# Altium project My_FOC_v1_Driver.PrjPcb
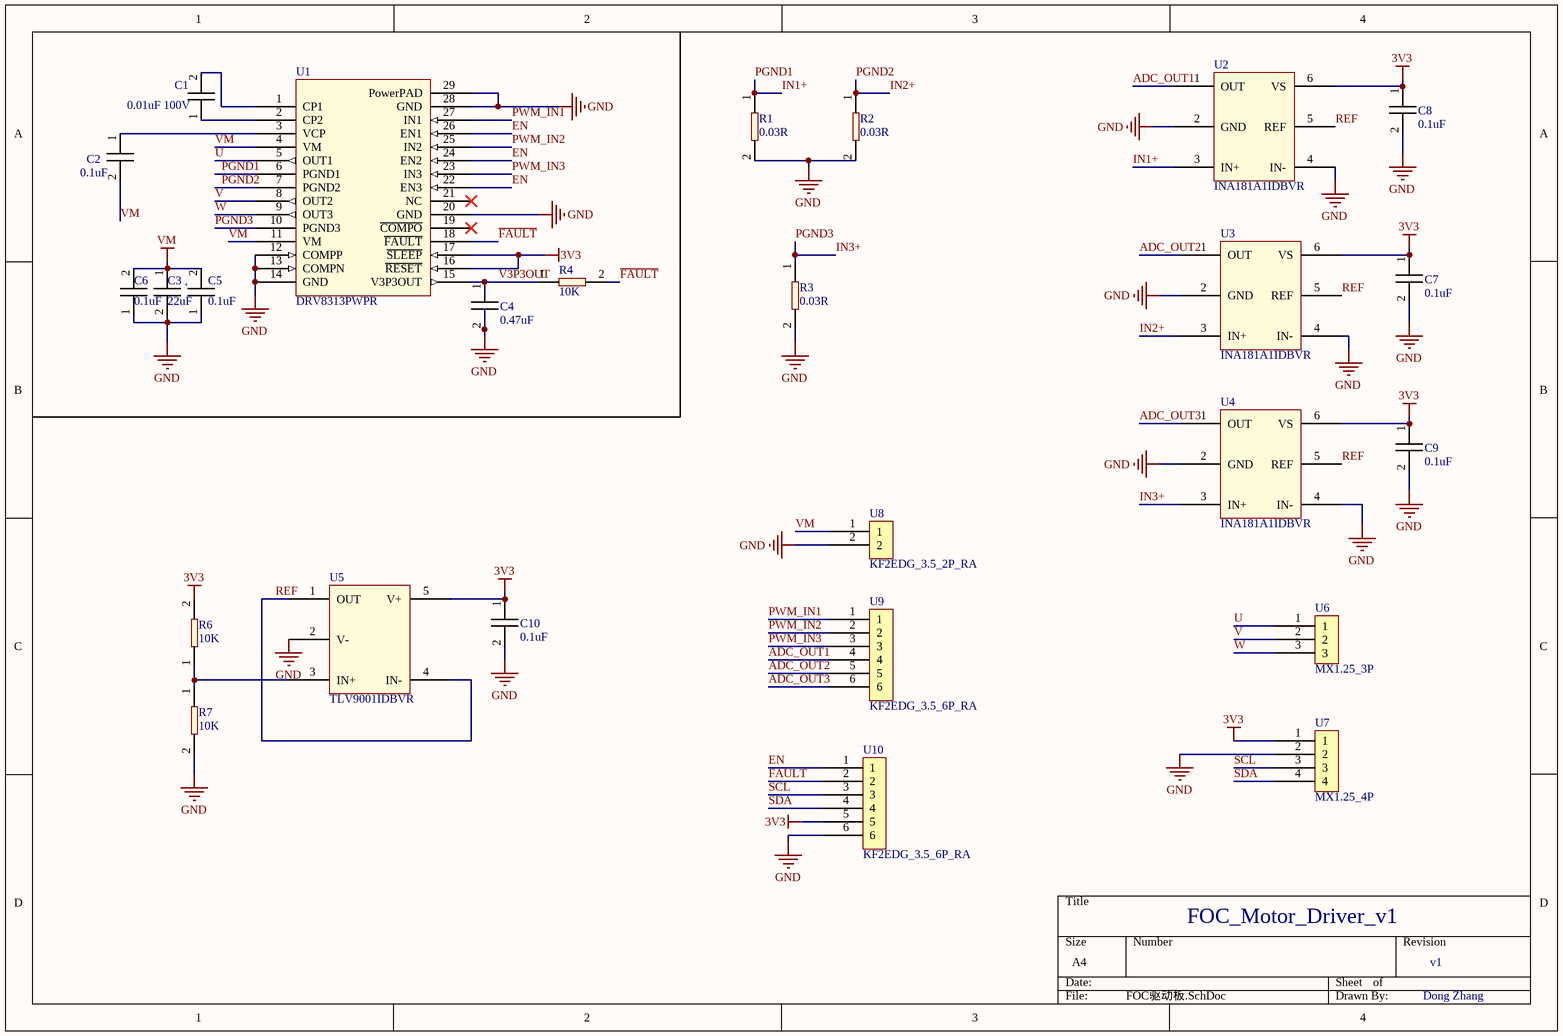
[diagram p0: FOC驱动板.SchDoc]
1 sheet, 26 parts. Net scope: global (net labels, ports and power ports of the same name join across sheets).
Board file: PCB1.PcbDoc

## Sheet FOC驱动板.SchDoc
size A4; SheetNumber: 1; SheetTotal: 1

### Parts
C1  0.01uF 100V  [CAP_0603_1608]
C2  0.1uF  [CAP_0603_1608]
C3  22uF  [ECAP_SMD_D5_H5.4]
C4  0.47uF  [CAP_0603_1608]
C5  0.1uF  [CAP_0603_1608]
C6  0.1uF  [CAP_0603_1608]
C7  0.1uF  [CAP_0603_1608]
C8  0.1uF  [CAP_0603_1608]
C9  0.1uF  [CAP_0603_1608]
C10  0.1uF  [CAP_0603_1608]
R1  0.03R  [R2512_SHUNT_2P]
R2  0.03R  [R2512_SHUNT_2P]
R3  0.03R  [R2512_SHUNT_2P]
R4  10K  [RES_0603_1608]
R6  10K  [RES_0603_1608]
R7  10K  [RES_0603_1608]
U1  DRV8313PWPR  [HTSSOP-28 PowerPAD]
U2  INA181A1IDBVR  [SOT23-6_DBV]
U3  INA181A1IDBVR  [SOT23-6_DBV]
U4  INA181A1IDBVR  [SOT23-6_DBV]
U5  TLV9001IDBVR  [SOT23-5_DBV]
U6  MX1.25_3P  [MX1.25_3P_SMT]
U7  MX1.25_4P  [MX1.25_4P_SMT]
U8  KF2EDG_3.5_2P_RA  [KF2EDG_3.5_2P_RA]
U9  KF2EDG_3.5_6P_RA  [KF2EDG_3.5_6P_RA]
U10  KF2EDG_3.5_6P_RA  [KF2EDG_3.5_6P_RA]

### Nets
3V3: C7.1 C8.1 C9.1 C10.1 R6.2 U1.16(~{RESET}) U1.17(~{SLEEP}) U2.6(VS) U3.6(VS) U4.6(VS) U5.5(V+) U7.1 U10.5
GND: C3.2 C4.2 C5.1 C6.1 C7.2 C8.2 C9.2 C10.2 R1.2 R2.2 R3.2 R7.2 U1.12(COMPP) U1.13(COMPN) U1.14(GND) U1.20(GND) U1.28(GND) U1.29(PowerPAD) U2.2(GND) U2.4(IN-) U3.2(GND) U3.4(IN-) U4.2(GND) U4.4(IN-) U5.2(V-) U7.2 U8.2 U10.6
VM: C2.2 C3.1 C5.2 C6.2 U1.4(VM) U1.11(VM) U8.1
ADC_OUT1: U2.1(OUT) U9.4
ADC_OUT2: U3.1(OUT) U9.5
ADC_OUT3: U4.1(OUT) U9.6
EN: U1.22(EN3) U1.24(EN2) U1.26(EN1) U10.1
~{FAULT}: R4.2 U1.18(~{FAULT}) U10.2
IN1+: R1.1 U1.6(PGND1) U2.3(IN+)  [also labelled PGND1]
IN2+: R2.1 U1.7(PGND2) U3.3(IN+)  [also labelled PGND2]
IN3+: R3.1 U1.10(PGND3) U4.3(IN+)  [also labelled PGND3]
PWM_IN1: U1.27(IN1) U9.1
PWM_IN2: U1.25(IN2) U9.2
PWM_IN3: U1.23(IN3) U9.3
REF: U2.5(REF) U3.5(REF) U4.5(REF) U5.1(OUT) U5.4(IN-)
SCL: U7.3 U10.3
SDA: U7.4 U10.4
U: U1.5(OUT1) U6.1
V: U1.8(OUT2) U6.2
V3P3OUT: C4.1 R4.1 U1.15(V3P3OUT)
W: U1.9(OUT3) U6.3
NetC1_1: C1.1 U1.2(CP2)
NetC1_2: C1.2 U1.1(CP1)
NetC2_1: C2.1 U1.3(VCP)
NetR6_1: R6.1 R7.1 U5.3(IN+)

Not connected (* = marked no-connect by the designer): U1 19(~{COMPO})* 21(NC)*

### Notes on the sheet
- FOC_Motor_Driver_v1
- v1
- Dong Zhang
- (in symbol 22uF_35V_ECAP) +

### Library data of the parts
C1 = 0.01uF_100V: 0603 X7R Ceramic Capacitor
C2 C5-C10 = 0.1uF_25V: 0603 X7R Ceramic Capacitor
C3 = 22uF_35V_ECAP: Polarized SMD Aluminum Electrolytic Capacitor
C4 = 0.47uF_16V: 0603 X7R Ceramic Capacitor
R1-R3 = 0.03R_RLP25: 大毅 RLP25 0.03R 2W采样电阻
R4 R6 R7 = 10K_ARG03: Viking ARG03DTC1002 0603 Thin Film Resistor
U1 = DRV8313PWPR: Three Half-H-Bridge Motor Driver MAX 26V 2.5A
U2-U4 = INA181A1IDBVR: Bidirectional Current Sense Amplifier